# Altium schematic sheet USB.SchDoc
size A4; Engineer: Naif aljohani; DocumentNumber: 4; Revision: v1.0; SheetNumber: 3; SheetTotal: 7; SPICEModelCacheVKQZRFRK: <root> / <DocumentId>VKQZRFRK</DocumentId> / </root>
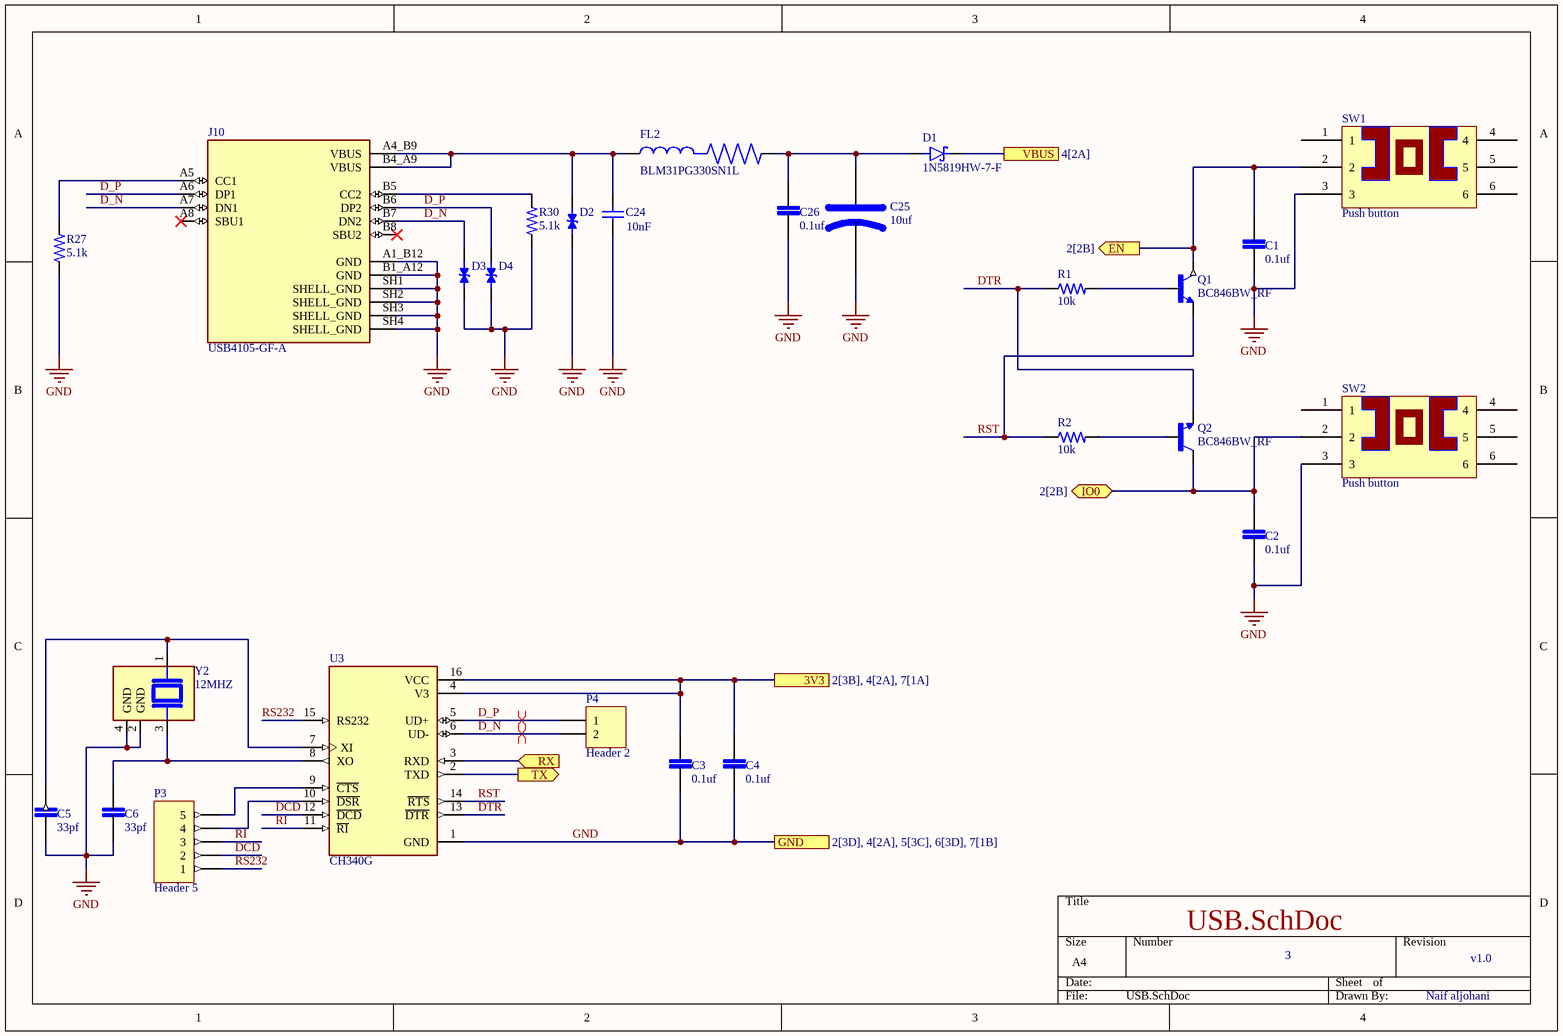
[diagram p0: USB.SchDoc]

## Parts
C1  0.1uf  [CAPC2012X140N]
C2  0.1uf  [CAPC2012X140N]
C3  0.1uf  [CAPC2012X140N]
C4  0.1uf  [CAPC2012X140N]
C5  33pf  [CAPC2012X140N]
C6  33pf  [CAPC2012X140N]
C24  value 10nF  [C1206]  (hidden comment: Cap Semi)
C25  10uf  [CAPAE660X550N]
C26  0.1uf  [CAPC2012X140N]
D1  1N5819HW-7-F  [SOD3715X145N]
D2  LESD5D5.0CT1G  [TVS_LESD5D5.0CT1G]  (value not drawn)
D3  LESD5D5.0CT1G  [TVS_LESD5D5.0CT1G]  (value not drawn)
D4  LESD5D5.0CT1G  [TVS_LESD5D5.0CT1G]  (value not drawn)
FL2  BLM31PG330SN1L  [BEADC3216X130N]
J10  USB4105-GF-A  [GCT_USB4105-GF-A]
P3  Header 5  [HDR1X5]
P4  Header 2  [HDR1X2]
Q1  BC846BW_RF  [TRANS_BC846BW_RF]
Q2  BC846BW_RF  [TRANS_BC846BW_RF]
R1  10k  [RESC3115X65N]
R2  10k  [RESC3115X65N]
R27  5.1k  [RESC3115X65N]
R30  5.1k  [RESC3115X65N]
SW1  Push button  [XKB5858-Z-TP-75]
SW2  Push button  [XKB5858-Z-TP-75]
U3  CH340G  [SOIC127P600X180-16N]
Y2  12MHZ  [XTAL_ABM8W-32.0000MHZ-6-B1U-T3]

## Ports
3V3 (see 2[3B], 4[2A], 7[1A]), EN (out, see 2[2B]), GND (see 2[3D], 4[2A], 5[3C], 6[3D], 7[1B]), IO0 (bidir, see 2[2B]), RX (in), TX (out), VBUS (see 4[2A])

## Nets
GND: C1.1 C2.1 C3.1 C4.1 C5.2 C6.2 C24.1 C25.N C26.1 D2.1 D3.1 D4.1 J10.A1_B12(GND) J10.B1_A12(GND) J10.SH1(SHELL_GND) J10.SH2(SHELL_GND) J10.SH3(SHELL_GND) J10.SH4(SHELL_GND) R27.1 R30.1 SW1.3 SW2.3 U3.1(GND) Y2.2(GND) Y2.4(GND) ; port GND
3V3: C3.2 C4.2 U3.4(V3) U3.16(VCC) ; port 3V3
D_N: D3.2 J10.A7(DN1) J10.B7(DN2) P4.2 U3.6(UD-)
D_P: D4.2 J10.A6(DP1) J10.B6(DP2) P4.1 U3.5(UD+)
DCD: P3.2 U3.12(~{DCD})
DTR: Q2.2(E) R1.1 U3.13(~{DTR})
EN: C1.2 Q1.3(C) SW1.2 ; port EN
IO0: C2.2 Q2.3(C) SW2.2 ; port IO0
RI: P3.3 U3.11(~{RI})
RS232: P3.1 U3.15(RS232)
RST: Q1.2(E) R2.1 U3.14(~{RTS})
RX: U3.3(RXD) ; port RX
TX: U3.2(TXD) ; port TX
VBUS: D1.C(K) ; port VBUS
NetC5_1: C5.1 U3.7(XI) Y2.1
NetC6_1: C6.1 U3.8(XO) Y2.3
NetC24_2: C24.2 D2.2 FL2.1 J10.A4_B9(VBUS) J10.B4_A9(VBUS)
NetC25_P: C25.P C26.2 D1.A FL2.2
NetJ10_A5: J10.A5(CC1) R27.2
NetJ10_B5: J10.B5(CC2) R30.2
NetP3_4: P3.4 U3.10(~{DSR})
NetP3_5: P3.5 U3.9(~{CTS})
NetQ1_1: Q1.1(B) R1.2
NetQ2_1: Q2.1(B) R2.2

Not connected (* = marked no-connect by the designer): J10 A8(SBU1)* B8(SBU2)*; SW1 1 4 5 6; SW2 1 4 5 6

## Layout directives
differential pair: D_N, D_P

## Library data of the parts
C1-C6 C26 = LD051A121KAB2A: 120PF 100V 10% 0805; MF: {'manufacturer': u'AVX'}; Package: None; Price: None; Value: *; MP: LD051A121KAB2A; Availability: Unavailable
C24 = Cap Semi: Capacitor (Semiconductor SIM Model); Published: 8-Jun-2000; LatestRevisionDate: 29-May-2009; LatestRevisionNote: IPC-7351 Footprint Added.; PackageReference: C1206; Publisher: Altium Limited; PackageDescription: Chip Capacitor
C25 = UWX1H100MCL1GB
D1 = 1N5819HW-7-F: 1N5819HW Series 40 V 1 A Surface Mount Schottky Barrier Rectifier - SOD-123; MF: {'manufacturer': u'Diodes Inc.'}; Package: None; Price: None; Value: *; MP: 1N5819HW-7-F; Availability: Unavailable
D2-D4 = LESD5D5.0CT1G: MF: {'manufacturer': u'Leshan Radio Co.'}; Package: None; Price: None; Value: *; MP: LESD5D5.0CT1G; Availability: Unavailable
FL2 = BLM31PG330SN1L: Ferrite Beads Multi-Layer 33Ohm 25% 100MHz 6A 9mOhm DCR 1206 T/R; MF: {'manufacturer': u'Murata Electronics'}; Package: None; Price: None; Value: *; MP: BLM31PG330SN1L; Availability: Unavailable
J10 = USB4105-GF-A: MF: {'manufacturer': u'GCT'}; Package: None; Price: None; Value: *; MP: USB4105-GF-A; Availability: Unavailable
P3 = Header 5: Header, 5-Pin; LatestRevisionDate: 17-Jul-2002; LatestRevisionNote: Re-released for DXP Platform.; Publisher: Altium Limited
P4 = Header 2: Header, 2-Pin; LatestRevisionDate: 17-Jul-2002; LatestRevisionNote: Re-released for DXP Platform.; Publisher: Altium Limited
Q1 Q2 = BC846BW_RF: MF: {'manufacturer': u'Taiwan Semiconductor'}; Package: None; Price: None; Value: *; MP: BC846BW_RF; Availability: Unavailable
R1 R2 R27 R30 = 1-1879462-4: RL73H 2B R43 1% 5K RL; MF: {'manufacturer': u'TE Connectivity'}; Package: None; Price: None; Value: *; MP: 1-1879462-4; Availability: Unavailable
SW1 SW2 = XKB5858-Z-TP-75: 250V 30V LATCHING Standing paste 100000 Times Without 160gf 100mA SMD Pushbutton Switches ROHS; ComponentLink1Description: Data sheet; ComponentLink1URL: https://www.lcsc.com/datasheet/lcsc_datasheet_2110111430_XKB-Connection-XKB5858-Z-TP-75_C692487.pdf
U3 = CH340G: MF: {'manufacturer': u'WCH'}; MP: CH340G; Package: None; Price: None; Value: *; Availability: Unavailable
Y2 = ABM8W-32.0000MHZ-6-B1U-T3: MF: {'manufacturer': u'Abracon'}; Package: None; Price: None; Value: *; MP: ABM8W-32.0000MHZ-6-B1U-T3; Availability: Unavailable